# Altium project avr32da32_board_V2.PrjPcb
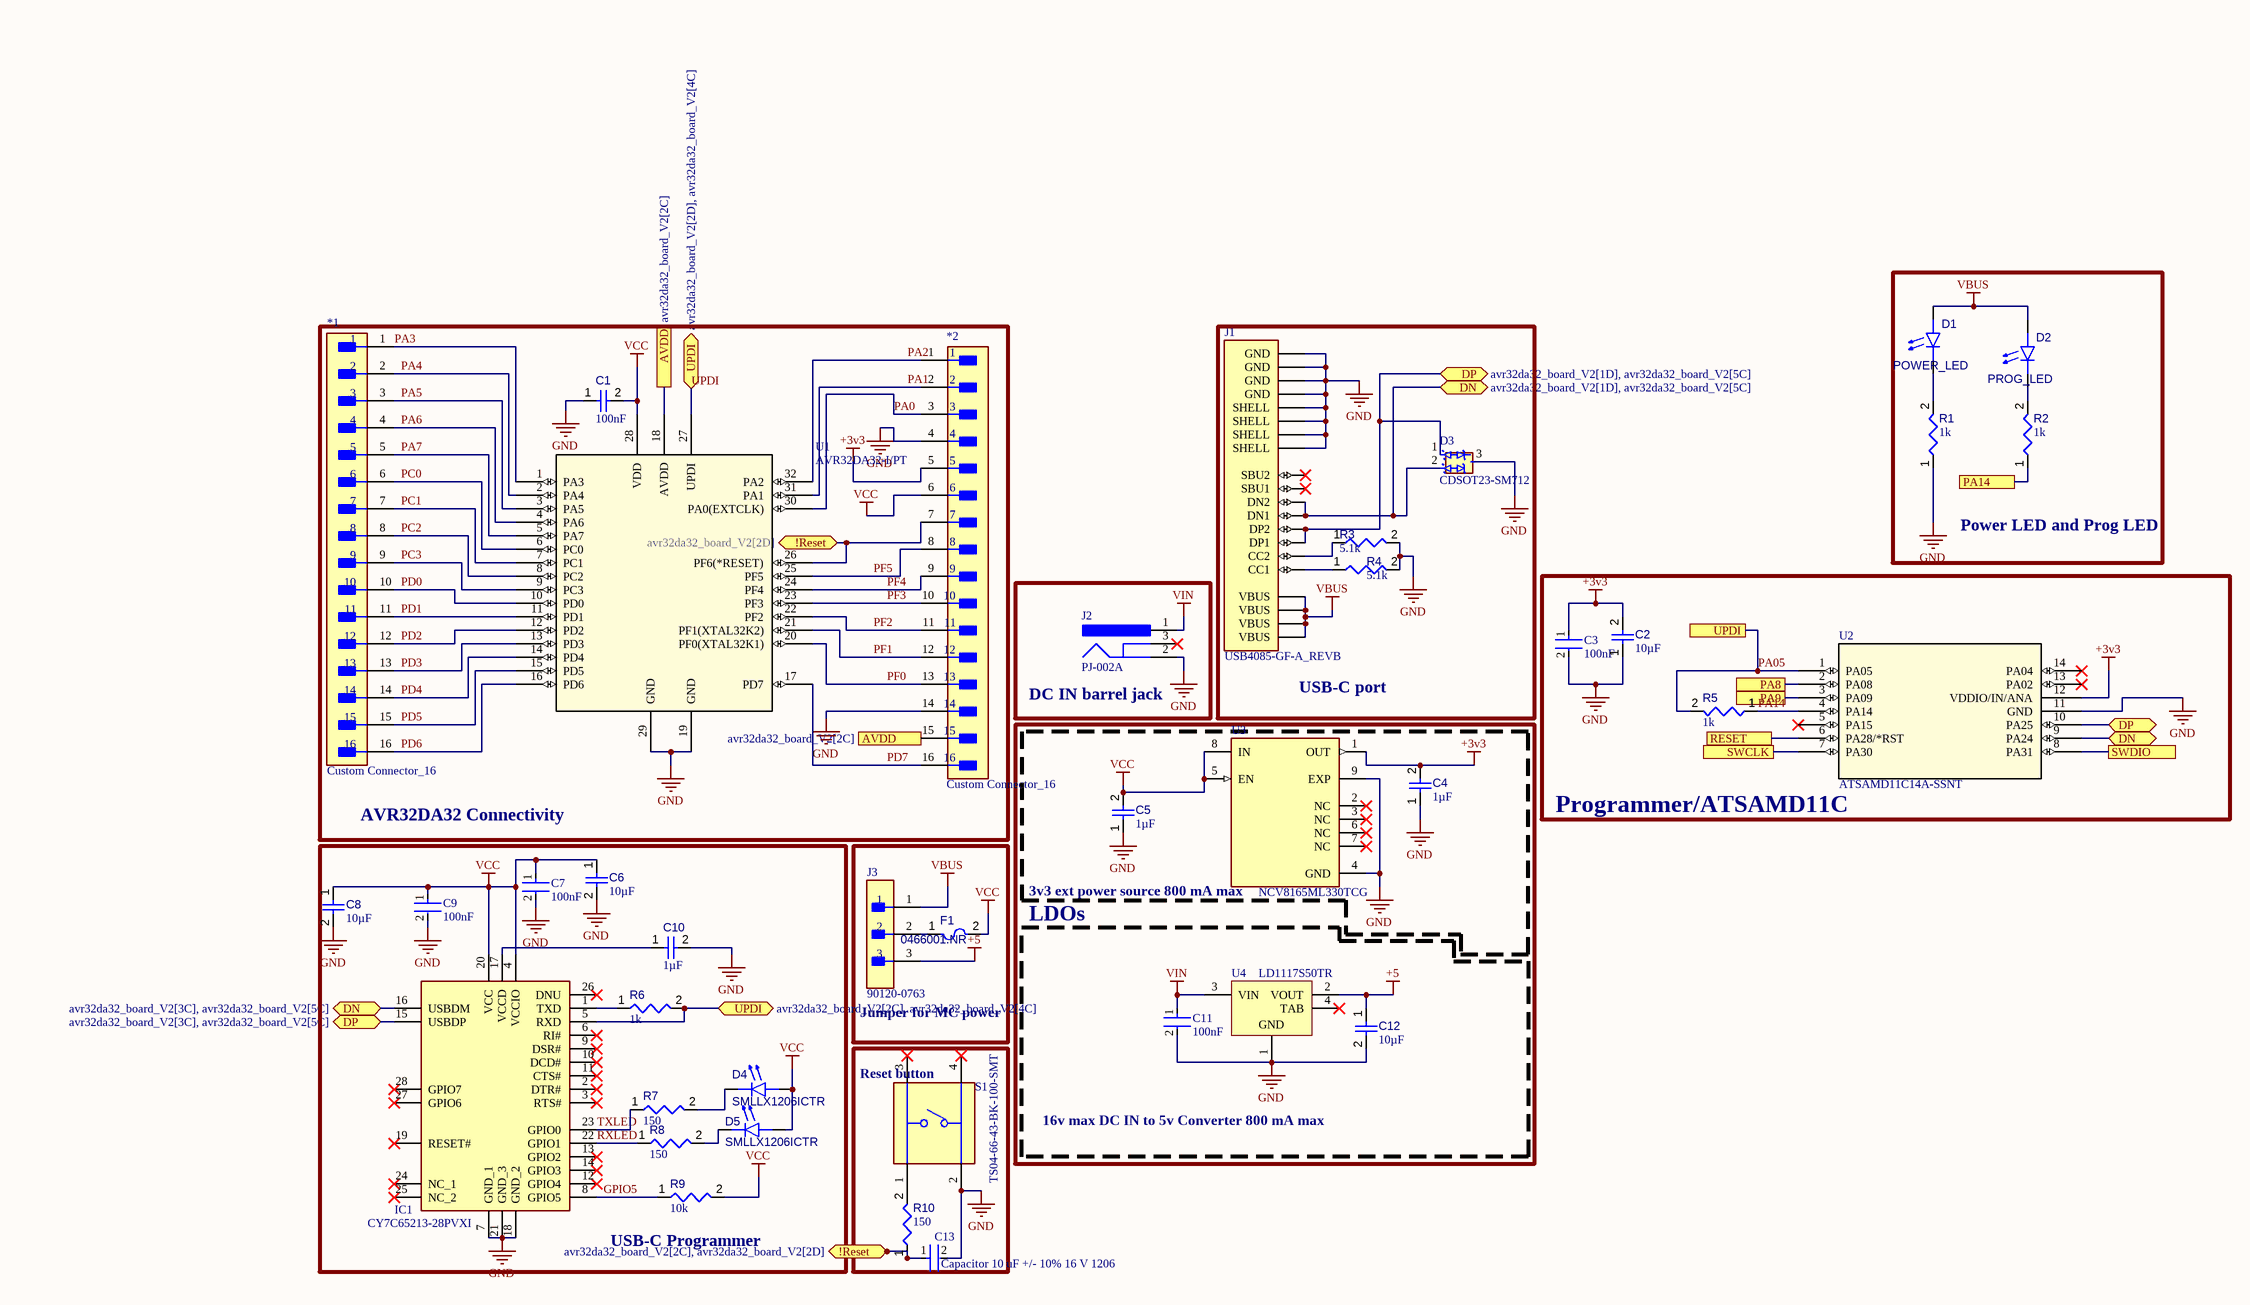
[diagram p0: avr32da32_board_V2.SchDoc]
1 sheet, 40 parts. Net scope: flat (ports and power ports of the same name join across sheets).
Board file: avr32da32_board_V2.PcbDoc

## Sheet avr32da32_board_V2.SchDoc
size C; SheetNumber: 1; SheetTotal: 1

### Parts
*1  Custom Connector_16  [Custom Connector_16]
*2  Custom Connector_16  [Custom Connector_16]
C1  value 100nF  [CAPC3216X180X50ML20T25]  (hidden comment: Capacitor 10 uF +/- 10% 16 V 1206)
C2  value 10µF  [CAPC3216X180X50NL20T25]  (hidden comment: Capacitor 10 uF +/- 10% 16 V 1206)
C3  value 100nF  [FP-C1206C-EB-MFG]  (hidden comment: C1206C104K2RACTU)
C4  value 1µF  [CAPC3216X180X20ML20]  (hidden comment: Capacitor 1 uF +/- 10% 25 V 1206)
C5  value 1µF  [CAPC3216X180X20ML20]  (hidden comment: Capacitor 1 uF +/- 10% 25 V 1206)
C6  value 10µF  [CAPC3216X180X50NL20T25]  (hidden comment: Capacitor 10 uF +/- 10% 16 V 1206)
C7  100nF  [FP-1206-L_3_2_0_2-W_1_6_0-MFG]
C8  value 10µF  [CAPC3216X180X50NL20T25]  (hidden comment: Capacitor 10 uF +/- 10% 16 V 1206)
C9  100nF  [FP-1206-L_3_2_0_2-W_1_6_0-MFG]
C10  value 1µF  [CAPC3216X180X20ML20]  (hidden comment: Capacitor 1 uF +/- 10% 25 V 1206)
C11  100nF  [FP-1206-L_3_2_0_2-W_1_6_0-MFG]
C12  value 10µF  [CAPC3216X180X50NL20T25]  (hidden comment: Capacitor 10 uF +/- 10% 16 V 1206)
C13  Capacitor 10 uF +/- 10% 16 V 1206  [CAPC3216X180X50ML20T25]
D1  POWER_LED  [LUMX-SML-LX1206IC_V]
D2  PROG_LED  [LUMX-SML-LX1206IC_V]
D3  CDSOT23-SM712  [SOT95P230X117-3N]
D4  SMLLX1206ICTR  [LUMX-SML-LX1206IC_V]
D5  SMLLX1206ICTR  [LUMX-SML-LX1206IC_V]
F1  0466001.NR  [FP-0466-MFG]
IC1  CY7C65213-28PVXI  [SOP65P780X200-28N]
J1  USB4085-GF-A_REVB  [GCT_USB4085-GF-A_REVB]
J2  PJ-002A  [CUI-PJ-002A_V]
J3  90120-0763  [FP-90120-0763-MFG]
R1  value 1k  [FP-MCA1206-IPC_B]  (hidden comment: MCA1206MD1001BP100)
R2  value 1k  [FP-MCA1206-IPC_B]  (hidden comment: MCA1206MD1001BP100)
R3  value 5.1k  [FP-CR1206-IPC_C]  (hidden comment: CR1206-JW-151ELF)
R4  value 5.1k  [FP-CR1206-IPC_C]  (hidden comment: CR1206-JW-151ELF)
R5  value 1k  [FP-MCA1206-IPC_B]  (hidden comment: MCA1206MD1001BP100)
R6  value 1k  [FP-MCA1206-IPC_B]  (hidden comment: MCA1206MD1001BP100)
R7  value 150  [FP-CR1206-IPC_C]  (hidden comment: CR1206-JW-151ELF)
R8  value 150  [FP-CR1206-IPC_C]  (hidden comment: CR1206-JW-151ELF)
R9  value 10k  [RESC3216X60X45ML15T20]  (hidden comment: Resistor 10k +/-1% 1206 250 mW)
R10  value 150  [FP-CR1206-IPC_C]  (hidden comment: CR1206-JW-151ELF)
S1  TS04-66-43-BK-100-SMT  [SW_TS04-66-43-BK-100-SMT]
U1  AVR32DA32-I/PT  [QFP80P900X900X120-32N]
U2  ATSAMD11C14A-SSNT  [SOIC14_SL_MCH]
U3  NCV8165ML330TCG  [FP-507AD-IPC_B]
U4  LD1117S50TR  [STM-SOT-223_M]

### Blocks framed on the sheet
Power LED and Prog LED: D1 D2 R1 R2
AVR32DA32 Connectivity: *1 *2 C1 U1
USB-C port: D3 J1 R3 R4
DC IN barrel jack: J2
Programmer/ATSAMD11C: C2 C3 R5 U2
3v3 ext power source 800 mA max: C4 C5 U3
USB-C Programmer: C6-C10 D4 D5 IC1 R6-R9
Jumper for MC power: F1 J3
LDOs: C11 C12 U4
Reset button: C13 R10 S1

### Ports
!Reset (bidir, see avr32da32_board_V2[2C], avr32da32_board_V2[2D]), !Reset (bidir, see avr32da32_board_V2[2D]), AVDD (see avr32da32_board_V2[2C]), DN (bidir, see avr32da32_board_V2[1D], avr32da32_board_V2[3C]), DN (bidir, see avr32da32_board_V2[1D], avr32da32_board_V2[5C]), DN (bidir, see avr32da32_board_V2[3C], avr32da32_board_V2[5C]), DP (bidir, see avr32da32_board_V2[1D], avr32da32_board_V2[3C]), DP (bidir, see avr32da32_board_V2[1D], avr32da32_board_V2[5C]), DP (bidir, see avr32da32_board_V2[3C], avr32da32_board_V2[5C]), PA8, PA9, PA14, RESET, SWCLK, SWDIO, UPDI (bidir, see avr32da32_board_V2[2C], avr32da32_board_V2[4C]), UPDI (bidir, see avr32da32_board_V2[2D], avr32da32_board_V2[4C]), UPDI (see avr32da32_board_V2[2C], avr32da32_board_V2[2D])

### Nets
+3v3: *2.5 C2.2 C3.1 C4.2 U2.12(VDDIO/IN/ANA) U3.1(OUT)
+5: C12.1 J3.3 U4.2(VOUT)
GND: *2.4 *2.14 C1.1 C2.1 C3.2 C4.1 C5.1 C6.2 C7.2 C8.2 C9.2 C10.2 C11.2 C12.2 C13.2 D3.3 IC1.7(GND_1) IC1.18(GND_2) IC1.21(GND_3) J1.A1(GND) J1.A12(GND) J1.B1(GND) J1.B12(GND) J1.S1(SHELL) J1.S2(SHELL) J1.S3(SHELL) J1.S4(SHELL) J2.2 R1.1 R3.2 R4.2 S1.2 U1.19(GND) U1.29(GND) U2.11(GND) U3.4(GND) U3.9(EXP) U4.1(GND)
VBUS: D1.2(A) D2.2(A) J1.A4(VBUS) J1.A9(VBUS) J1.B4(VBUS) J1.B9(VBUS) J3.1
VCC: *2.6 C1.2 C5.2 C6.1 C7.1 C8.1 C9.1 D4.2(A) D5.2(A) F1.2 IC1.4(VCCIO) IC1.20(VCC) R9.2 U1.28(VDD) U3.5(EN) U3.8(IN)
VIN: C11.1 J2.1 U4.3(VIN)
GPIO5: IC1.8(GPIO5) R9.1
PA0: *2.3 U1.30(PA0(EXTCLK))
PA1: *2.2 U1.31(PA1)
PA2: *2.1 U1.32(PA2)
PA3: *1.1 U1.1(PA3)
PA4: *1.2 U1.2(PA4)
PA05: IC1.5(RXD) R5.2 R6.2 U1.27(UPDI) U2.1(PA05) ; port UPDI  [also labelled UPDI]
PA5: *1.3 U1.3(PA5)
PA6: *1.4 U1.4(PA6)
PA7: *1.5 U1.5(PA7)
PA14: R5.1 U2.4(PA14)
PC0: *1.6 U1.6(PC0)
PC1: *1.7 U1.7(PC1)
PC2: *1.8 U1.8(PC2)
PC3: *1.9 U1.9(PC3)
PD0: *1.10 U1.10(PD0)
PD1: *1.11 U1.11(PD1)
PD2: *1.12 U1.12(PD2)
PD3: *1.13 U1.13(PD3)
PD4: *1.14 U1.14(PD4)
PD5: *1.15 U1.15(PD5)
PD6: *1.16 U1.16(PD6)
PD7: *2.16 U1.17(PD7)
PF0: *2.13 U1.20(PF0(XTAL32K1))
PF1: *2.12 U1.21(PF1(XTAL32K2))
PF2: *2.11 U1.22(PF2)
PF3: *2.10 U1.23(PF3)
PF4: *2.9 U1.24(PF4)
PF5: *2.8 U1.25(PF5)
RXLED: IC1.22(GPIO1) R8.1
TXLED: IC1.23(GPIO0) R7.1
Net*2_7: *2.7 C13.1 R10.1 U1.26(PF6(*RESET)) ; port !Reset
Net*2_15: *2.15 U1.18(AVDD) ; port AVDD
NetC10_1: C10.1 IC1.17(VCCD)
NetD1_1: D1.1(K) R1.2
NetD2_1: D2.1(K) R2.2
NetD3_1: D3.1 IC1.15(USBDP) J1.A6(DP1) J1.B6(DP2) U2.10(PA25) ; port DP
NetD3_2: D3.2 IC1.16(USBDM) J1.A7(DN1) J1.B7(DN2) U2.9(PA24) ; port DN
NetD4_1: D4.1(K) R7.2
NetD5_1: D5.1(K) R8.2
NetF1_1: F1.1 J3.2
NetIC1_1: IC1.1(TXD) R6.1
NetJ1_A5: J1.A5(CC1) R4.1
NetJ1_B5: J1.B5(CC2) R3.1
NetR2_1: R2.1 ; port PA14
NetR10_2: R10.2 S1.1
NetU2_2: U2.2(PA08) ; port PA8
NetU2_3: U2.3(PA09) ; port PA9
NetU2_6: U2.6(PA28/*RST) ; port RESET
NetU2_7: U2.7(PA30) ; port SWCLK
NetU2_8: U2.8(PA31) ; port SWDIO

Not connected (* = marked no-connect by the designer): IC1 2(DTR#)* 3(RTS#)* 6(RI#)* 9(DSR#)* 10(DCD#)* 11(CTS#)* 12(GPIO4)* 13(GPIO2)* 14(GPIO3)* 19(RESET#)* 24(NC_1)* 25(NC_2)* 26(DNU)* 27(GPIO6)* 28(GPIO7)*; J1 A8(SBU1)* B8(SBU2)*; J2 3*; S1 3* 4*; U2 5(PA15)* 13(PA02)* 14(PA04)*; U3 2(NC)* 3(NC)* 6(NC)* 7(NC)*; U4 4(TAB)*

### Notes on the sheet
- 16v max DC IN to 5v Converter 800 mA max

### Library data of the parts
C1 C2 C6 C8 C12 = CMP-001-00016-6: Chip Capacitor, 10 uF, +/- 10%, 16 V, 1206 (3216 Metric); Capacitor Type: Ceramic; Voltage Rating: 16V; Tolerance: 10%; Min Operating Temperature: -55°C; Pins: 2; Mounting Technology: SM; Case/Package: 1206; Max Operating Temperature: 125°C; RoHS Compliant: True
C3 = CMP-001-00085-1: Ceramic Capacitor, Multilayer, Ceramic, 200V, 10% +Tol, 10% -Tol, X7R, 15% TC, 0.1uF, Surface Mount, 1206; Max Operating Temperature: 125°C; RoHS Compliant: Yes; Mounting Technology: Surface Mount; Case/Package: 1206; Pins: 2; Min Operating Temperature: -55°C; Capacitor Type: Ceramic
C4 C5 C10 = CMP-001-00006-6: Chip Capacitor, 1 uF, +/- 10%, 25 V, 1206 (3216 Metric); Capacitor Type: Ceramic; Voltage Rating: 25V; Tolerance: 10%; Min Operating Temperature: -55°C; Pins: 2; Case/Package: 1206; Max Operating Temperature: 125°C; Mounting Technology: SM; RoHS Compliant: True
C7 C9 C11 C13 = CMP-2000-05018-2: General Purpose Ceramic Capacitor, 1206, 100nF, 10%, X7R, 15%, 50V; Dissipation Factor: 2.5%; Insulation Resistance: 100GR; Dielectric: X7R; Thickness: 0.037inch; Case Code (Imperial): 1206; Case Code (Metric): 3216; Dielectric Material: Ceramic; Width: 1.6mm; Voltage Rating (DC): 50V; Termination: SMD/SMT; Tolerance: 10%; REACH SVHC: No SVHC; Height: 0.94mm; Length: 3.2mm; Voltage: 50V; Capacitance: 100nF; Packaging: Tape and Reel; Depth: 1.6mm; Voltage Rating: 50V; Series: -; Contact Plating: Tin; Mount: Surface Mount; Package Quantity: 1; Construction: Flat; Max Operating Temperature: 125°C; Min Operating Temperature: -55°C; Case/Package: 1206; Lead Free: Lead Free; RoHS Compliant: Yes; Number of Pins: 2; Radiation Hardening: No
D1 D2 D4 D5 = CMP-007-00044-1: LED Uni-Color Red 635nm 2-Pin T/R
D3 = CMP-004-00031-2: CDSOT23-SM712 Dual Bi-Directional TVS Diode 400W 3-Pin SOT-23; MF: Bourns; Source: CDSOT23-SM712.SchLib; Check_prices: https://www.snapeda.com/parts/CDSOT23-SM712/Bourns/view-part/?ref=eda; MP: CDSOT23-SM712; Design Item ID: CDSOT23-SM712; Value: *; Component Type: Standard; Case/Package: SOT-23 Bourns; Pins: 3; SnapEDA_Link: https://www.snapeda.com/parts/CDSOT23-SM712/Bourns/view-part/?ref=snap
F1 = CMP-005-00014-1: Electric Fuse, Very Fast Blow, 1A, 63VAC, 63VDC, 50A (IR), Surface Mount, 1206; Current Rating: 1A; RoHS Compliant: Yes; Min Operating Temperature: -55°C; Mounting Technology: Surface Mount; Max Operating Temperature: 90°C
IC1 = CY7C65213-28PVXI: Integrated Circuit; Manufacturer_Name: Infineon; Datasheet Link: http://www.mouser.com/datasheet/2/100/001-81011_CY7C65213_USB-UART_LP_Bridge_Controller_-348826.pdf; Height: 2mm; Manufacturer_Part_Number: CY7C65213-28PVXI; Mouser Part Number: 727-CY7C65213-28PVXI; Mouser Price/Stock: https://www.mouser.co.uk/ProductDetail/Infineon-Technologies/CY7C65213-28PVXI?qs=dOK1vf2izjvExqwVZ7qYig%3D%3D; Arrow Part Number: CY7C65213-28PVXI; Arrow Price/Stock: https://www.arrow.com/en/products/cy7c65213-28pvxi/cypress-semiconductor?region=nac
J1 = CMP-012-000000-1: USB-C (USB TYPE-C) USB 2.0 æ’åº§è¿žæŽ¥å™¨ 24 (16+8 Dummy) ä½é€šå­”ã€ç›´è§’ã€ä½Žæˆæœ¬ã€3.46mm å¤–å½¢ã€16 é’ˆã€æ°´å¹³ã€é¡¶éƒ¨å®‰è£…; MF: Global Connector Technology; Pin Count: 20; Package: None; Check_prices: https://www.snapeda.com/parts/USB4085-GF-A/Global+Connector+Technology/view-part/?ref=eda; Value: *; Design Item ID: USB4085-GF-A_REVB; MP: USB4085-GF-A; Component Type: Standard; SnapEDA_Link: https://www.snapeda.com/parts/USB4085-GF-A/Global+Connector+Technology/view-part/?ref=snap; Source: USB4085-GF-A_REVB.SchLib
J2 = CMP-002-00078-1: 12V, 1A, 2mm Dia; Connector Type: Circular,Power; Voltage Rating: 12V; Mounting Technology: Board; RoHS Compliant: Yes
J3 = CMP-002-00075-2: Board Connector, 3 Contact(s), 1 Row(s), Male, Straight, 0.1 inch Pitch, Solder Terminal, Black Insulator, Receptacle; Mounting Technology: Board; Max Operating Temperature: 125°C; Connector Type: BOARD CONNECTOR; Min Operating Temperature: -55°C; RoHS Compliant: Yes
R1 R2 R5 R6 = CMP-009-00186-1: Fixed Resistor, Thin Film, 0.25W, 1000ohm, 200V, 0.1% +/-Tol, 25ppm/Cel, Surface Mount, 1206; Power: 400mW; Pins: 2; Max Operating Temperature: 155°C; Case/Package: 1206; RoHS Compliant: Yes; Tolerance: 0.1%; Min Operating Temperature: -55°C
R3 R4 R7 R8 R10 = CMP-009-00182-1: Fixed Resistor, Metal Glaze/thick Film, 0.25W, 150ohm, 200V, 5% +/-Tol, 200ppm/Cel, Surface Mount, 1206; Power: 250mW; Case/Package: 1206; RoHS Compliant: Yes; Max Operating Temperature: 155°C; Tolerance: 5%; Pins: 2; Mounting Technology: Surface Mount; Min Operating Temperature: -55°C
R9 = CMP-009-00016-5: Chip Resistor, 10 KOhm, +/- 1%, 0.25 W, -55 to 155 degC, 1206 (3216 Metric); Power: 250mW; Voltage Rating: 200V; Pins: 2; Max Operating Temperature: 155°C; Tolerance: 1%; RoHS Compliant: True; Case/Package: 1206; Min Operating Temperature: -55°C; Mounting Technology: SM
S1 = CMP-014-000000-2: Tactile Switches 6 x 6 mm, 4.3 mm Act Height, 100 gf, Black, Surface Mount, SPST,; Availability: Unavailable; Component Type: Standard; Source: TS04-66-43-BK-100-SMT.SchLib; Package: None; Pin Count: 4; Price: None; Value: *; Design Item ID: TS04-66-43-BK-100-SMT; MP: TS04-66-43-BK-100-SMT
U1 = CMP-031-00006-3: RISC Microcontroller, 8-Bit, FLASH, AVR CPU, 24MHz, CMOS, PQFP32; Mfr_Name: Microchip; Max Supply Voltage: 5.5V; Min Supply Voltage: 1.8V; RoHS Compliant: Yes; Design Item ID: AVR32DA32-IPT; Case/Package: TQFP32; RefDes: RefDes; ComponentLink1Description: https://www.digikey.ro/ro/products/detail/microchip-technology/AVR32DA32-I-PT/12396890; Type: Type; Source: AVR32DA32-IPT.SchLib; Mounting Technology: SMD
U2 = ATSAMD11C14A-SSNT: No Description Available; Mfr_Name: Microchip; RefDes: RefDes; Type: Type
U3 = CMP-012-00001-1: Fixed Positive LDO Regulator, 3.3V, 0.29V Dropout, PDSO8
U4 = CMP-019-00006-3: Fixed Low Drop Positive Voltage Regulator, 5 V, 0 to 125 degC, 4-Pin SOT223, RoHS, Tape and Reel; Manufacturer: STMicroelectronics; Max Input Voltage: 15V; Min Supply Voltage: 6.5V; Max Ouput Current: 1.3A; Output Voltage: 5V; Output Current: 950mA; Dropout Voltage: 1.1V; Power: 12W; Outputs: 1; Packaging: TapeandReel; Datasheet URL: http://www.st.com/content/ccc/resource/technical/document/datasheet/99/3b/7d/91/91/51/4b/be/CD00000544.pdf/files/CD00000544.pdf/jcr:content/translations/en.CD00000544.pdf; Package Reference: SOT-223; RoHS Compliant: True; Datasheet Version: Nov-13; Min Operating Temperature: 0°C; Case/Package: TO-261-4; Pins: 4; Manufacturer URL: http://www.st.com/; Mounting Technology: SM; Package Quantity: 2500; Nominal Output Voltage: 5V; Max Supply Voltage: 15V; Min Input Voltage: 6.5V; Max Operating Temperature: 125°C; Package Description: 4-Pin Small Outline Transistor, Body 6.5 x 3.5 mm, Pitch 2.3 mm